# Altium project Flow_Meter_prototyope.PrjPcb
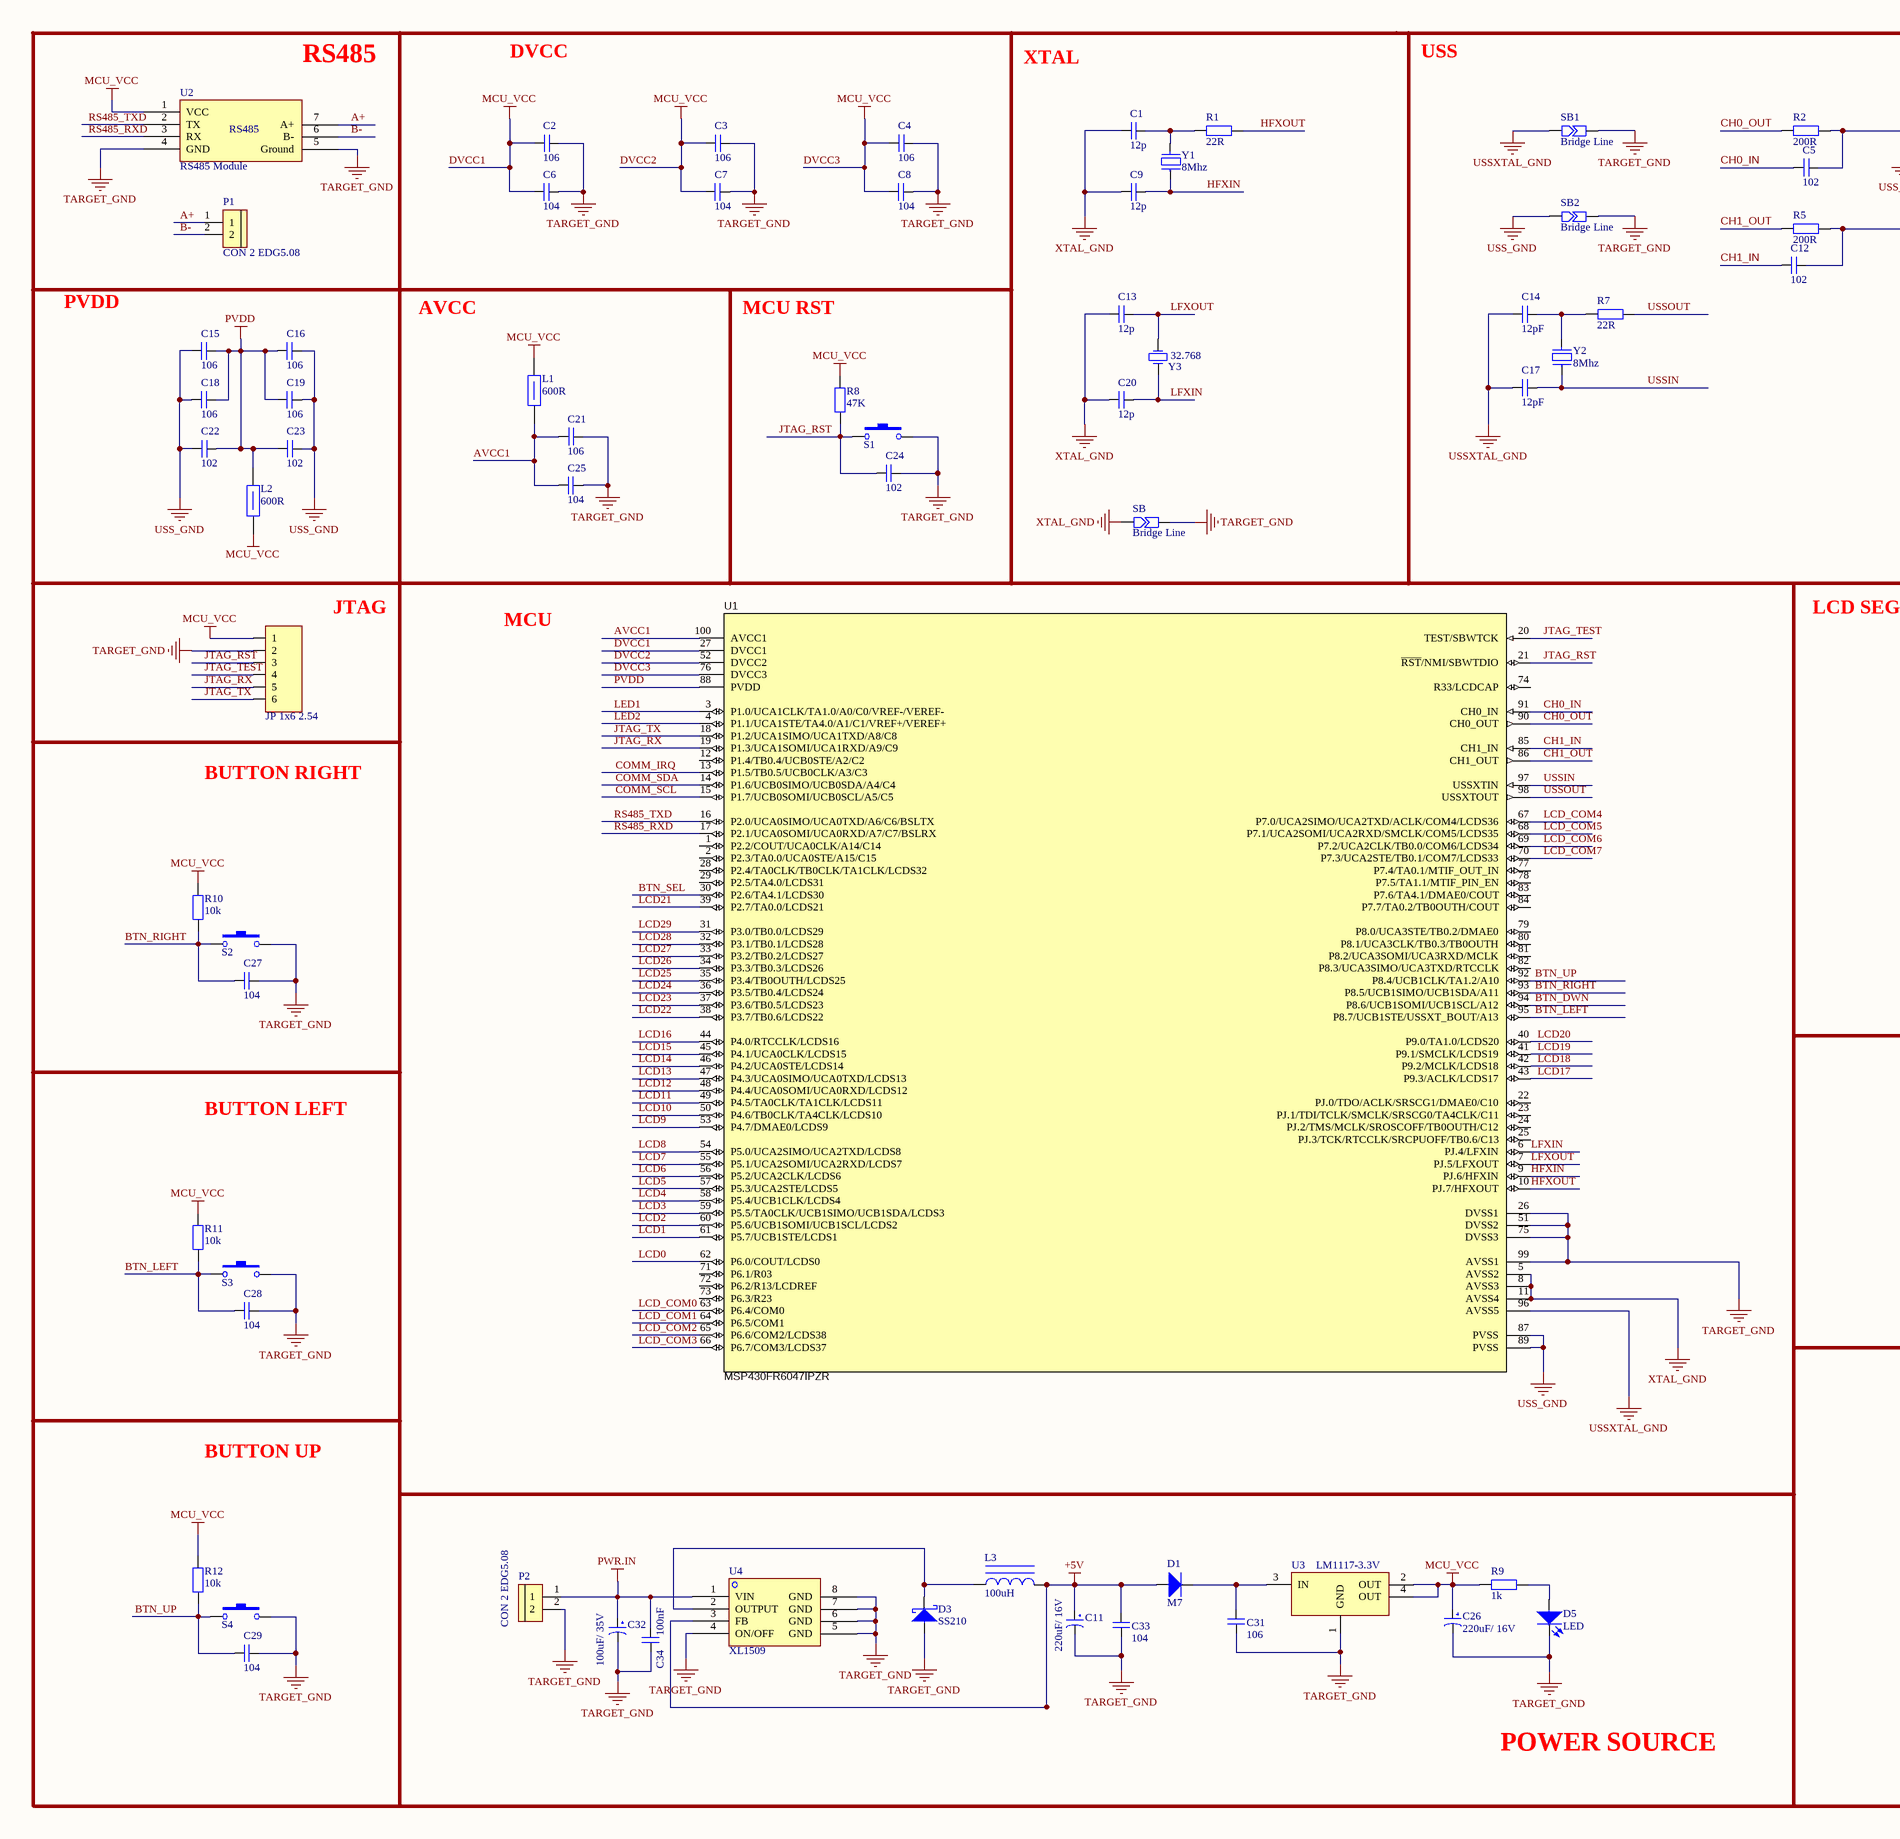
[diagram p0: Main_schematic.SchDoc, left]
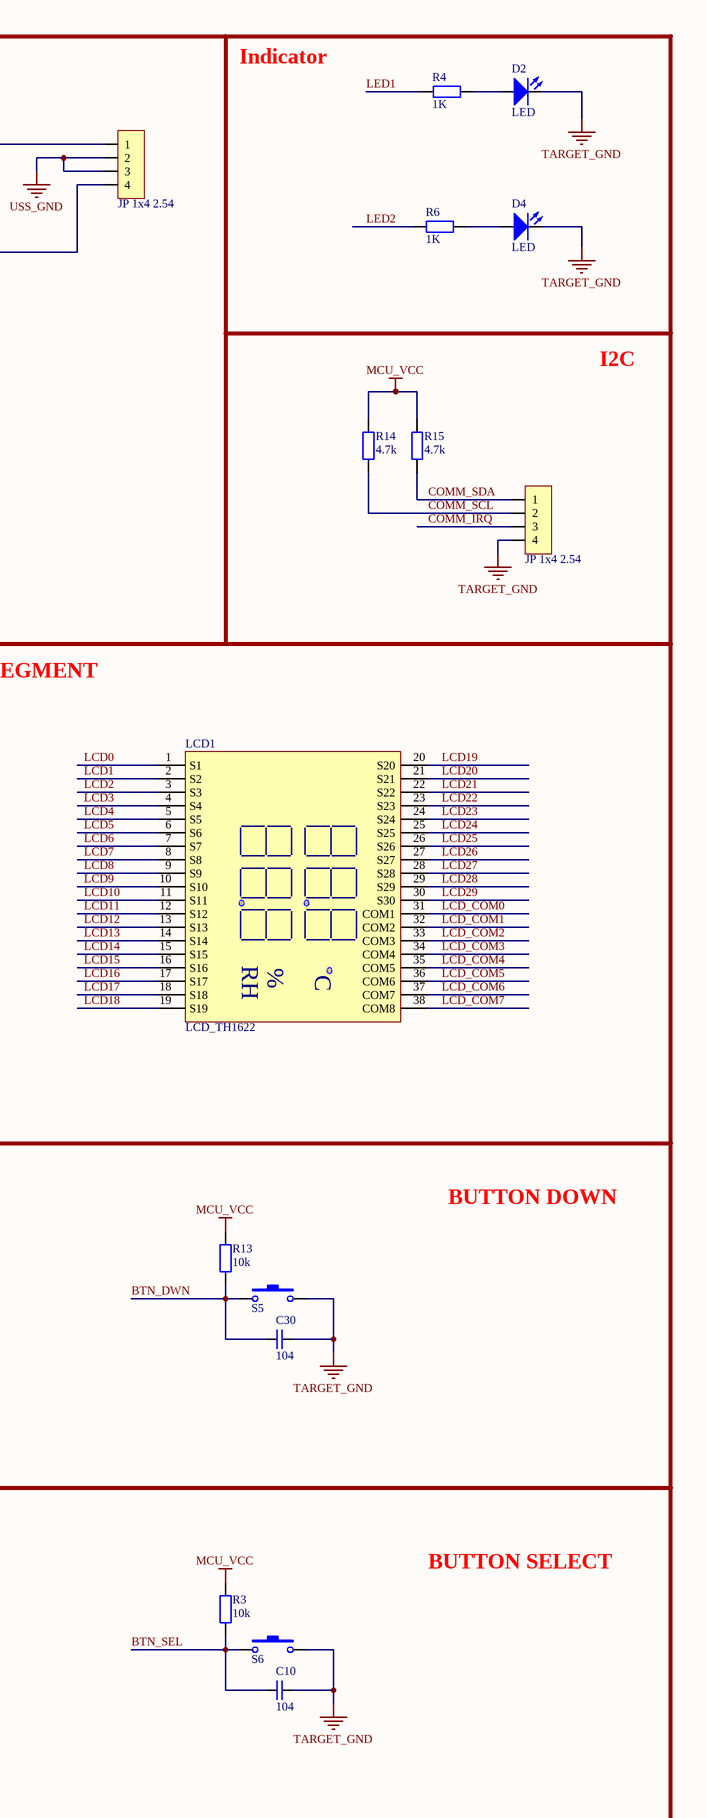
[diagram p1: Main_schematic.SchDoc, right]
1 sheet, 79 parts. Net scope: global (net labels, ports and power ports of the same name join across sheets).
Board file: Prototype_PCB.PcbDoc

## Sheet Main_schematic.SchDoc
size 508 x 381 mm; SheetNumber: 1; SheetTotal: 1

### Parts
C1  12p  [SM-0805]
C2  106  [SM-0805]
C3  106  [SM-0805]
C4  106  [SM-0805]
C5  102  [SM-0805]
C6  104  [SM-0805]
C7  104  [SM-0805]
C8  104  [SM-0805]
C9  12p  [SM-0805]
C10  104  [SM-0805]
C11  220uF/ 16V  [CAP SMD ALUMINUM D8]
C12  102  [SM-0805]
C13  12p  [SM-0805]
C14  12pF  [SM-0805]
C15  106  [SM-0805]
C16  106  [SM-0805]
C17  12pF  [SM-0805]
C18  106  [SM-0805]
C19  106  [SM-0805]
C20  12p  [SM-0805]
C21  106  [SM-0805]
C22  102  [SM-0805]
C23  102  [SM-0805]
C24  102  [SM-0805]
C25  104  [SM-0805]
C26  220uF/ 16V  [CAP SMD ALUMINUM D8]
C27  104  [SM-0805]
C28  104  [SM-0805]
C29  104  [SM-0805]
C30  104  [SM-0805]
C31  106  [SM-0805]
C32  100uF/ 35V  [CAP SMD ALUMINUM D8]
C33  104  [SM-0805]
C34  100nF  [SM-0805]
D1  M7  [DO-214AC]
D2  LED  [LED-3MM GRE]
D3  SS210  [DO-214AC]
D4  LED  [LED-3MM GRE]
D5  LED  [LED-3MM RED]
JP1  JP 1x4 2.54  [JP 1x4 DT]
JP2  JP 1x4 2.54  [JP 1x4 DT]
JP4  JP 1x6 2.54  [JP 1x6 DT]
L1  600R  [WE-CBF_0805_High Speed]
L2  600R  [WE-CBF_0805_High Speed]
L3  100uH  [INDUCTOR SMD 7342 7.3X7.3X4.2mm]
LCD1  LCD_TH1622  [LCD_HT1622]
P1  CON 2 EDG5.08  [CON 2 2EDG5.08]
P2  CON 2 EDG5.08  [CON 2 2EDG5.08]
R1  22R  [RESISTOR SMD 0805]
R2  200R  [RESISTOR SMD 0805]
R3  10k  [RESISTOR SMD 0805]
R4  1K  [RESISTOR SMD 0805]
R5  200R  [RESISTOR SMD 0805]
R6  1K  [RESISTOR SMD 0805]
R7  22R  [RESISTOR SMD 0805]
R8  47K  [RESISTOR SMD 0805]
R9  1k  [RESISTOR SMD 0805]
R10  10k  [RESISTOR SMD 0805]
R11  10k  [RESISTOR SMD 0805]
R12  10k  [RESISTOR SMD 0805]
R13  10k  [RESISTOR SMD 0805]
R14  4.7k  [RESISTOR SMD 0805]
R15  4.7k  [RESISTOR SMD 0805]
S1  SW  [BUTTON-SMD 2PIN]  (value not drawn)
S2  SW  [BUTTON-SMD 2PIN]  (value not drawn)
S3  SW  [BUTTON-SMD 2PIN]  (value not drawn)
S4  SW  [BUTTON-SMD 2PIN]  (value not drawn)
S5  SW  [BUTTON-SMD 2PIN]  (value not drawn)
S6  SW  [BUTTON-SMD 2PIN]  (value not drawn)
SB  Bridge Line  [SB 0603]
SB1  Bridge Line  [SB 0603]
SB2  Bridge Line  [SB 0603]
U1  MSP430FR6047IPZR  [*PZ0100A_L]
U2  RS485 Module  [RS485_MODULE SMD]
U3  LM1117-3.3V  [SOT223-4N]
U4  XL1509  [SOP8]
Y1  8Mhz  [Thach Anh 2 chan SMD]
Y2  8Mhz  [Thach Anh 2 chan SMD]
Y3  32.768  [THACH ANH DAN 3215]

### Nets
+5V: C11.1 C33.1 D1.1 L3.2 U4.3(FB)
DVCC1: C2.1 C3.1 C4.1 C6.2 C7.2 C8.2 C26.1 JP4.1 L1.2 L2.1 R3.2 R8.2 R9.1 R10.2 R11.2 R12.2 R13.2 R14.1 R15.1 U1.27(DVCC1) U1.52(DVCC2) U1.76(DVCC3) U2.1(VCC) U3.2(OUT) U3.4(OUT)  [also labelled DVCC2, DVCC3, MCU_VCC]
PVDD: C15.1 C16.2 C18.1 C19.2 C22.2 C23.1 L2.2 U1.88(PVDD)
PWR.IN: C32.1 C34.2 P2.1 U4.1(VIN)
TARGET_GND: C2.2 C3.2 C4.2 C6.1 C7.1 C8.1 C10.1 C11.2 C21.2 C24.1 C25.1 C26.2 C27.1 C28.1 C29.1 C30.1 C31.1 C32.2 C33.2 C34.1 D2.2 D3.1 D4.2 D5.2 JP2.4 JP4.2 P2.2 S1.2 S2.2 S3.2 S4.2 S5.2 S6.2 SB.2 SB1.2 SB2.2 U1.26(DVSS1) U1.51(DVSS2) U1.75(DVSS3) U1.99(AVSS1) U2.4(GND) U2.5(Ground) U3.1(GND) U4.4(ON/OFF) U4.5(GND) U4.6(GND) U4.7(GND) U4.8(GND)
USS_GND: C15.2 C16.1 C18.2 C19.1 C22.1 C23.2 JP1.2 JP1.3 SB2.1 U1.87(PVSS) U1.89(PVSS)
USSXTAL_GND: C14.1 C17.1 SB1.1 U1.96(AVSS5)
XTAL_GND: C1.1 C9.1 C13.1 C20.1 SB.1 U1.5(AVSS2) U1.8(AVSS3) U1.11(AVSS4)
A+: P1.1 U2.7(A+)
AVCC1: C21.1 C25.2 L1.1 U1.100(AVCC1)
B-: P1.2 U2.6(B-)
BTN_DWN: C30.2 R13.1 S5.1 U1.94(P8.6/UCB1SOMI/UCB1SCL/A12)
BTN_LEFT: C28.2 R11.1 S3.1 U1.95(P8.7/UCB1STE/USSXT_BOUT/A13)
BTN_RIGHT: C27.2 R10.1 S2.1 U1.93(P8.5/UCB1SIMO/UCB1SDA/A11)
BTN_SEL: C10.2 R3.1 S6.1 U1.30(P2.6/TA4.1/LCDS30)
BTN_UP: C29.2 R12.1 S4.1 U1.92(P8.4/UCB1CLK/TA1.2/A10)
CH0_IN: C5.1 U1.91(CH0_IN)
CH0_OUT: R2.2 U1.90(CH0_OUT)
CH1_IN: C12.1 U1.85(CH1_IN)
CH1_OUT: R5.2 U1.86(CH1_OUT)
COMM_IRQ: JP2.3 U1.13(P1.5/TB0.5/UCB0CLK/A3/C3)
COMM_SCL: JP2.2 R14.2 U1.15(P1.7/UCB0SOMI/UCB0SCL/A5/C5)
COMM_SDA: JP2.1 R15.2 U1.14(P1.6/UCB0SIMO/UCB0SDA/A4/C4)
HFXIN: C9.2 U1.9(PJ.6/HFXIN) Y1.1
HFXOUT: R1.1 U1.10(PJ.7/HFXOUT)
JTAG_RST: C24.2 JP4.3 R8.1 S1.1 U1.21(~{RST}/NMI/SBWTDIO)
JTAG_RX: JP4.5 U1.19(P1.3/UCA1SOMI/UCA1RXD/A9/C9)
JTAG_TEST: JP4.4 U1.20(TEST/SBWTCK)
JTAG_TX: JP4.6 U1.18(P1.2/UCA1SIMO/UCA1TXD/A8/C8)
LCD0: LCD1.1(S1) U1.62(P6.0/COUT/LCDS0)
LCD1: LCD1.2(S2) U1.61(P5.7/UCB1STE/LCDS1)
LCD2: LCD1.3(S3) U1.60(P5.6/UCB1SOMI/UCB1SCL/LCDS2)
LCD3: LCD1.4(S4) U1.59(P5.5/TA0CLK/UCB1SIMO/UCB1SDA/LCDS3)
LCD4: LCD1.5(S5) U1.58(P5.4/UCB1CLK/LCDS4)
LCD5: LCD1.6(S6) U1.57(P5.3/UCA2STE/LCDS5)
LCD6: LCD1.7(S7) U1.56(P5.2/UCA2CLK/LCDS6)
LCD7: LCD1.8(S8) U1.55(P5.1/UCA2SOMI/UCA2RXD/LCDS7)
LCD8: LCD1.9(S9) U1.54(P5.0/UCA2SIMO/UCA2TXD/LCDS8)
LCD9: LCD1.10(S10) U1.53(P4.7/DMAE0/LCDS9)
LCD10: LCD1.11(S11) U1.50(P4.6/TB0CLK/TA4CLK/LCDS10)
LCD11: LCD1.12(S12) U1.49(P4.5/TA0CLK/TA1CLK/LCDS11)
LCD12: LCD1.13(S13) U1.48(P4.4/UCA0SOMI/UCA0RXD/LCDS12)
LCD13: LCD1.14(S14) U1.47(P4.3/UCA0SIMO/UCA0TXD/LCDS13)
LCD14: LCD1.15(S15) U1.46(P4.2/UCA0STE/LCDS14)
LCD15: LCD1.16(S16) U1.45(P4.1/UCA0CLK/LCDS15)
LCD16: LCD1.17(S17) U1.44(P4.0/RTCCLK/LCDS16)
LCD17: LCD1.18(S18) U1.43(P9.3/ACLK/LCDS17)
LCD18: LCD1.19(S19) U1.42(P9.2/MCLK/LCDS18)
LCD19: LCD1.20(S20) U1.41(P9.1/SMCLK/LCDS19)
LCD20: LCD1.21(S21) U1.40(P9.0/TA1.0/LCDS20)
LCD21: LCD1.22(S22) U1.39(P2.7/TA0.0/LCDS21)
LCD22: LCD1.23(S23) U1.38(P3.7/TB0.6/LCDS22)
LCD23: LCD1.24(S24) U1.37(P3.6/TB0.5/LCDS23)
LCD24: LCD1.25(S25) U1.36(P3.5/TB0.4/LCDS24)
LCD25: LCD1.26(S26) U1.35(P3.4/TB0OUTH/LCDS25)
LCD26: LCD1.27(S27) U1.34(P3.3/TB0.3/LCDS26)
LCD27: LCD1.28(S28) U1.33(P3.2/TB0.2/LCDS27)
LCD28: LCD1.29(S29) U1.32(P3.1/TB0.1/LCDS28)
LCD29: LCD1.30(S30) U1.31(P3.0/TB0.0/LCDS29)
LCD_COM0: LCD1.31(COM1) U1.63(P6.4/COM0)
LCD_COM1: LCD1.32(COM2) U1.64(P6.5/COM1)
LCD_COM2: LCD1.33(COM3) U1.65(P6.6/COM2/LCDS38)
LCD_COM3: LCD1.34(COM4) U1.66(P6.7/COM3/LCDS37)
LCD_COM4: LCD1.35(COM5) U1.67(P7.0/UCA2SIMO/UCA2TXD/ACLK/COM4/LCDS36)
LCD_COM5: LCD1.36(COM6) U1.68(P7.1/UCA2SOMI/UCA2RXD/SMCLK/COM5/LCDS35)
LCD_COM6: LCD1.37(COM7) U1.69(P7.2/UCA2CLK/TB0.0/COM6/LCDS34)
LCD_COM7: LCD1.38(COM8) U1.70(P7.3/UCA2STE/TB0.1/COM7/LCDS33)
LED1: R4.2 U1.3(P1.0/UCA1CLK/TA1.0/A0/C0/VREF-/VEREF-)
LED2: R6.2 U1.4(P1.1/UCA1STE/TA4.0/A1/C1/VREF+/VEREF+)
LFXIN: C20.2 U1.6(PJ.4/LFXIN) Y3.1(OSC1)
LFXOUT: C13.2 U1.7(PJ.5/LFXOUT) Y3.2(OSC2)
RS485_RXD: U1.17(P2.1/UCA0SOMI/UCA0RXD/A7/C7/BSLRX) U2.3(RX)
RS485_TXD: U1.16(P2.0/UCA0SIMO/UCA0TXD/A6/C6/BSLTX) U2.2(TX)
USSIN: C17.2 U1.97(USSXTIN) Y2.1
USSOUT: R7.1 U1.98(USSXTOUT)
NetC1_2: C1.2 R1.2 Y1.2
NetC5_2: C5.2 JP1.1 R2.1
NetC12_2: C12.2 JP1.4 R5.1
NetC14_2: C14.2 R7.2 Y2.2
NetC31_2: C31.2 D1.2 U3.3(IN)
NetD2_1: D2.1 R4.1
NetD3_2: D3.2 L3.1 U4.2(OUTPUT)
NetD4_1: D4.1 R6.1
NetD5_1: D5.1 R9.2

Not connected (* = marked no-connect by the designer): U1 1(P2.2/COUT/UCA0CLK/A14/C14) 2(P2.3/TA0.0/UCA0STE/A15/C15) 12(P1.4/TB0.4/UCB0STE/A2/C2) 22(PJ.0/TDO/ACLK/SRSCG1/DMAE0/C10) 23(PJ.1/TDI/TCLK/SMCLK/SRSCG0/TA4CLK/C11) 24(PJ.2/TMS/MCLK/SROSCOFF/TB0OUTH/C12) 25(PJ.3/TCK/RTCCLK/SRCPUOFF/TB0.6/C13) 28(P2.4/TA0CLK/TB0CLK/TA1CLK/LCDS32) 29(P2.5/TA4.0/LCDS31) 71(P6.1/R03) 72(P6.2/R13/LCDREF) 73(P6.3/R23) 74(R33/LCDCAP) 77(P7.4/TA0.1/MTIF_OUT_IN) 78(P7.5/TA1.1/MTIF_PIN_EN) 79(P8.0/UCA3STE/TB0.2/DMAE0) 80(P8.1/UCA3CLK/TB0.3/TB0OUTH) 81(P8.2/UCA3SOMI/UCA3RXD/MCLK) 82(P8.3/UCA3SIMO/UCA3TXD/RTCCLK) 83(P7.6/TA4.1/DMAE0/COUT) 84(P7.7/TA0.2/TB0OUTH/COUT)

### Notes on the sheet
- (near U2) RS485
- DVCC
- XTAL
- USS
- Indicator
- PVDD
- AVCC
- MCU RST
- I2C
- JTAG
- MCU
- LCD SEGMENT
- BUTTON RIGHT
- BUTTON DOWN
- BUTTON LEFT
- BUTTON UP
- BUTTON SELECT
- POWER SOURCE
- (in symbol LCD_TH_1622) RH; %; C
- (in symbol RS484 Module) RS485

### Library data of the parts
C1-C10 C12-C25 C27-C31 C33 C34 = Cap_Non-Polar
C11 C26 C32 = Cap_Polar
D1 = Diode Standard: Part Number: LED 3 ly Single Colour; Pricing: *
D2 D4 D5 = LED: LED Single; Value: LED 3 ly Single Colour
D3 = Diode Schottky: Part Number: LED 3 ly Single Colour; Pricing: *
JP1 JP2 = JP 1x4 2.54 Duc Thang: Cắm; Ten_Linh_Kien: Jump Đơn Đực 2.54MM 1x40P Thẳng 11MM; Don_Vi: Con; Ma_Hang: MH000903; Ghi_Chu: *; Kieu_Chan: *; Chung_Loai: Cắm
JP4 = JP 1x6 2.54 Duc Thang: Cắm; Ten_Linh_Kien: Jump Đơn Đực 2.54MM 1x40P Thẳng 11MM; Don_Vi: Con; Ma_Hang: MH000903; Ghi_Chu: *; Kieu_Chan: *; Chung_Loai: Cắm
L1 L2 = FERRITE BEAD: WE-CBF SMD EMI Suppression Ferrite Bead, 0805, 11Ω; PartNumber: 7427920; Type: High Speed; PublishedDate: Aug 2016; Publisher: Wurth Elektronik; ComponentLink1Description: Manufacturer; ComponentLink1URL: http://www.we-online.de; ComponentLink2Description: Datasheet; ComponentLink2URL: http://katalog.we-online.de/pbs/datasheet/7427920.pdf; Value: 11Ω; Size: 0805
L3 = Inductor Iron: Magnetic-Core Inductor; Value: 150 mH
LCD1 = LCD_TH_1622: segment
P1 P2 = CON 2 EDG5.08: Cắm; Ten_Linh_Kien: CON 2 2EDG5.08-2P 5.08MM ( Xanh Cong); Ma_Hang: MH000759; Ghi_Chu: *; Don_Vi: Con; Kieu_Chan: *; Chung_Loai: Cắm
R1-R15 = Resistor
S1-S6 = SW-Button: Switch-Button; Published: 24-Mar-1999; LatestRevisionDate: 17-Jul-2002; LatestRevisionNote: Re-released for DXP Platform.; PackageReference: SPST-2; Publisher: Altium Limited
SB SB1 SB2 = Bridge Line: Bridge Line connect
U1 = MSP430FR6047IPZR: Mixed-Signal Microcontroller, PZ0100A (LQFP-100); Manufacturer: Texas Instruments; SymbolCreator: Altium; SizeArea_mm2: 256; SizeAreaWB_mm2: 324; SizeX_mm: 16; SizeZ_mm: 1.6; CompType: IC; U/M: EA; SymbolVersion: 2016-11-29; PartNumber: MSP430FR6047IPZR; Alternate PartNumber: MSP430FR6047IPZ; PackageReference: PZ0100A; PackageDescription: LQFP-100; MountType: SMT; SizeY_mm: 16; ComponentLink1Description: Datasheet Link; ComponentLink1URL: https://sps06.itg.ti.com/sites/KMS/crossdivteams/altium/docs/ComponentDatasheets/SLASEB7_MSP430FR6047_Int.pdf; Publisher: Texas Instruments; LatestRevisionDate: 2016-11-30; Alternate Manufacturer: Texas Instruments
U2 = RS484 Module: Module
U3 = LM1117: 800mA Low-Dropout Linear Regulator; Creator: Nguyen Ba Bien; Website: http://group3i.net
U4 = XL1509: IC power sop8
Y1 Y2 = Thach Anh 2 chan SMD: Crystal For all Crystal 2pin.; Value: 4Mhz
Y3 = Thach Anh SMD 3225: C700805; Chung_Loai: Dán; Ten_Linh_Kien: Thạch Anh 16Mhz SMD5032; Ma_Hang: MH001979; Don_Vi: Con; Ghi_Chu: *; Kieu_Chan: *